# Altium schematic sheet Motor_Driver_Sheet3.SchDoc (part 1 of 2)
size 420 x 297 mm; SheetNumber: 19; SheetTotal: 26
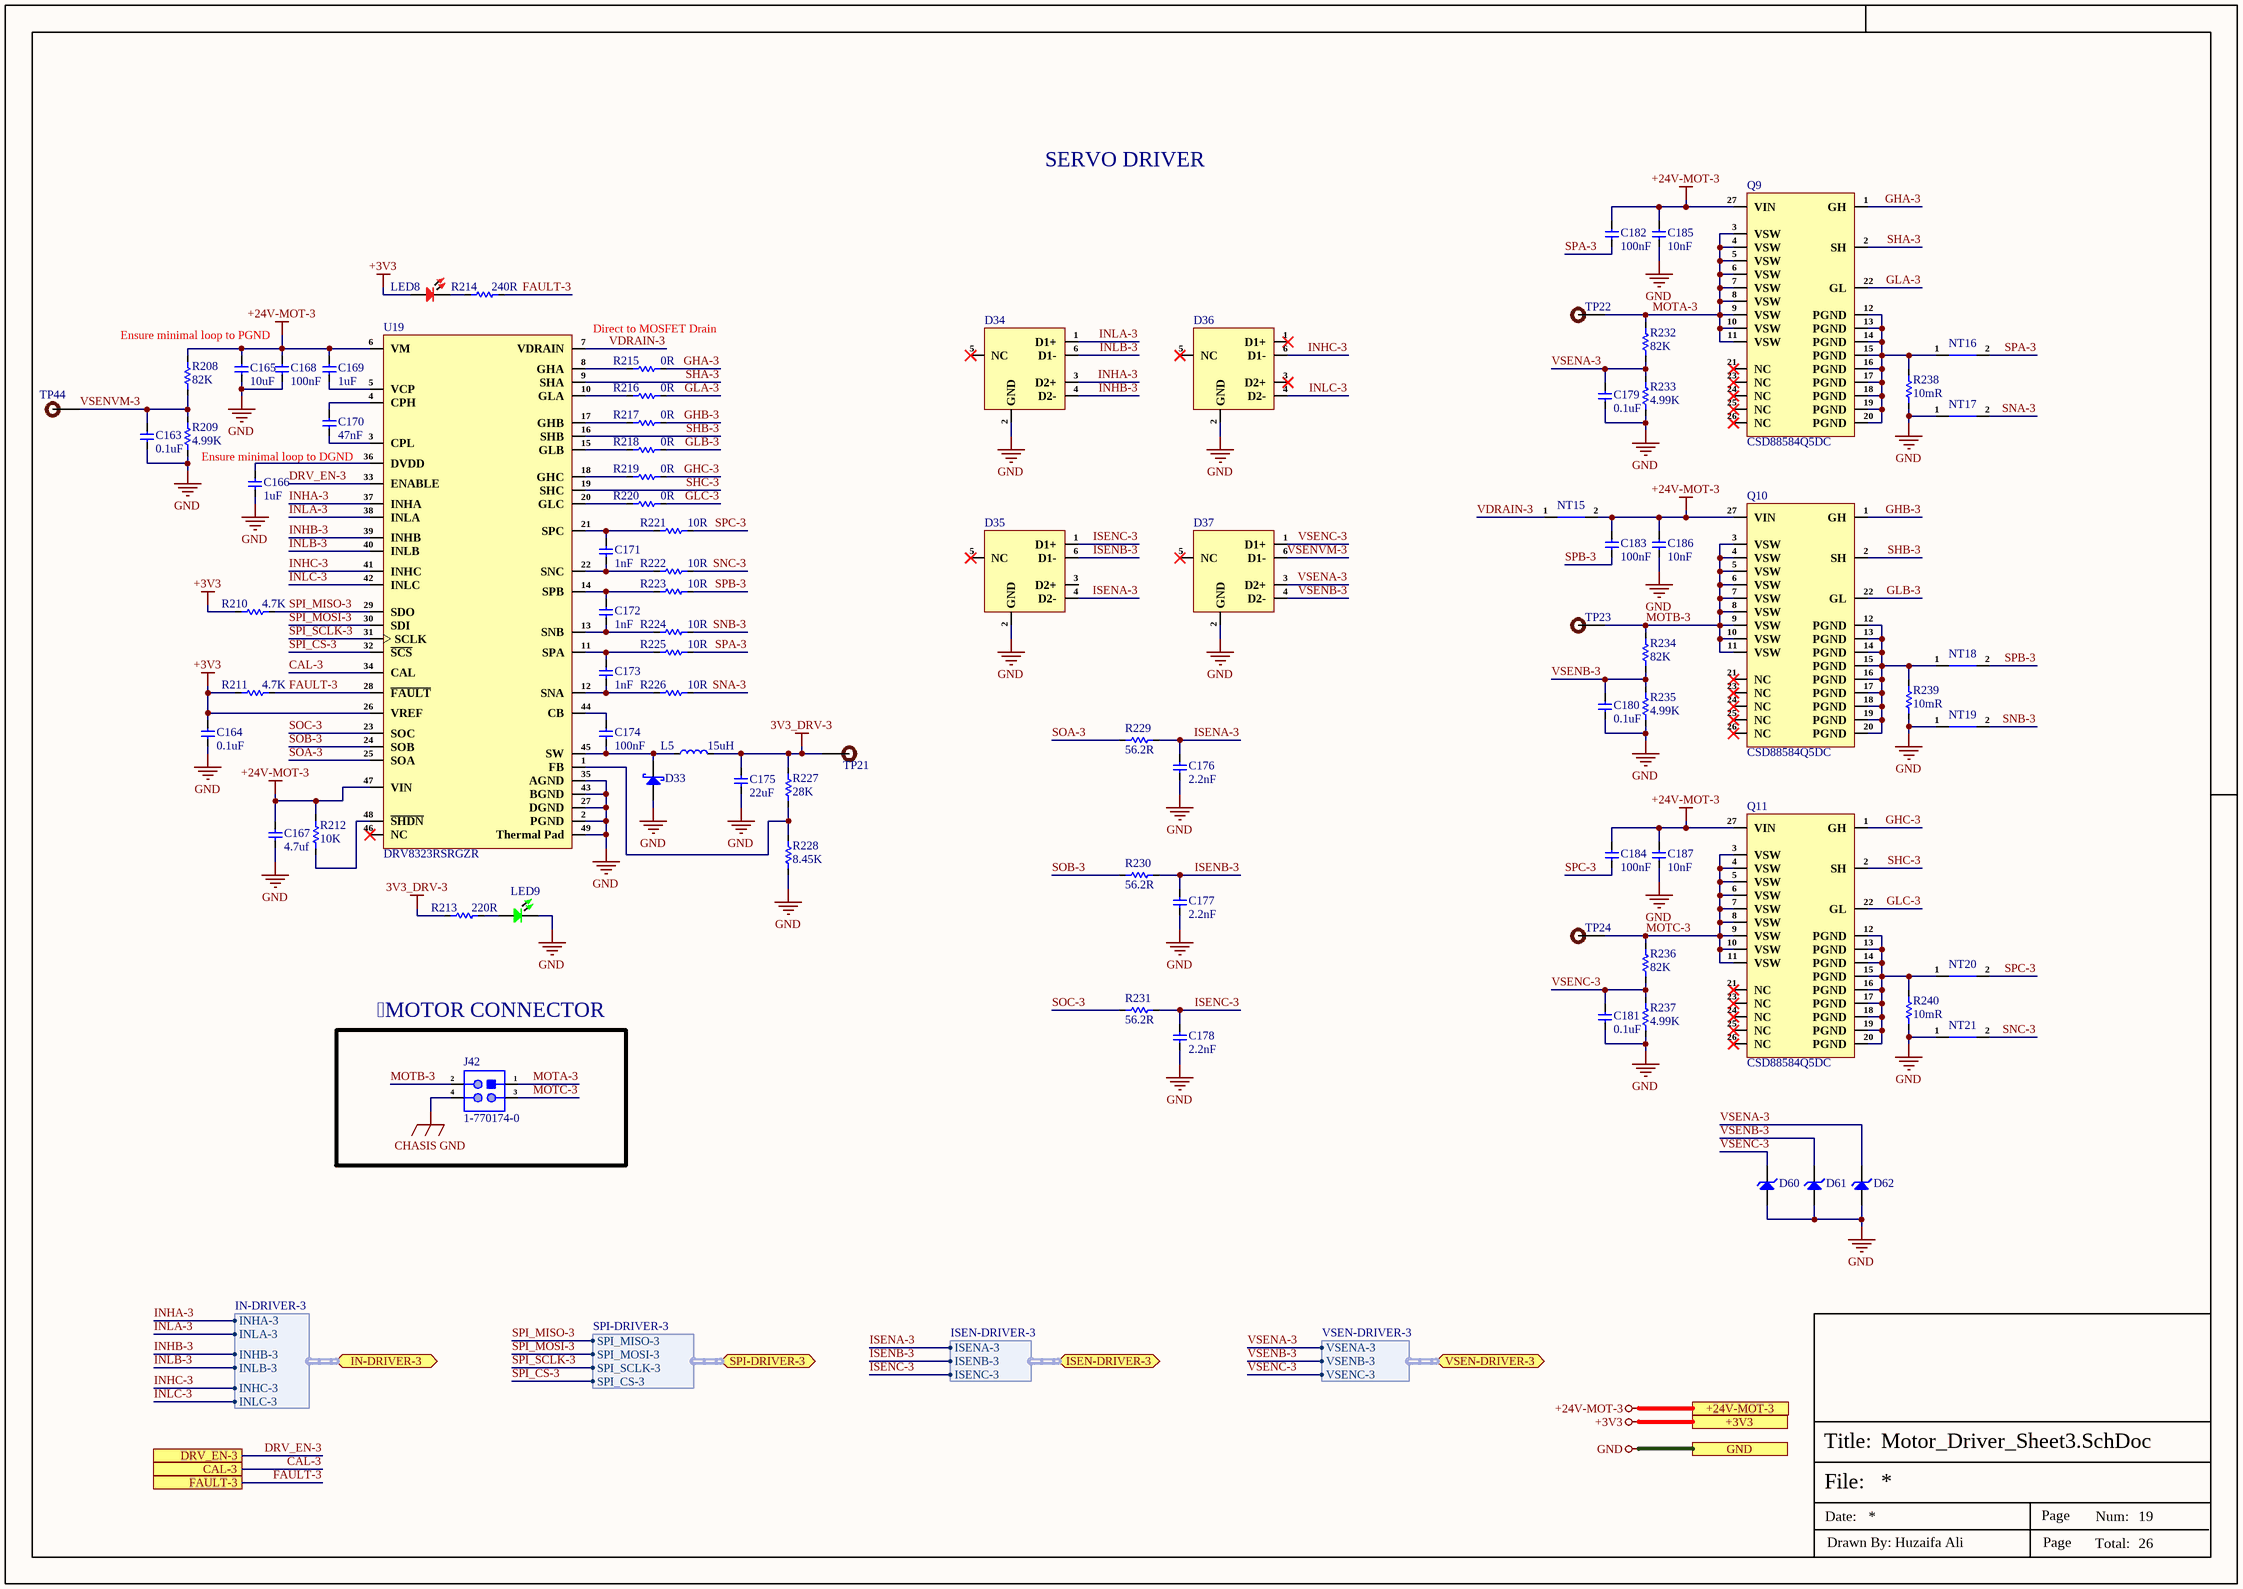
[diagram p0: Motor_Driver_Sheet3.SchDoc]

## Parts
C163  0.1uF  [Cap-0402]
C164  0.1uF  [Cap-0402]
C165  10uF  [Cap-1206]
C166  1uF  [Cap-0603]
C167  4.7uf  [Cap-0805]
C168  100nF  [Cap-0603]
C169  1uF  [Cap-0603]
C170  47nF  [Cap-0402]
C171  1nF  [Cap-0402]
C172  1nF  [Cap-0402]
C173  1nF  [Cap-0402]
C174  100nF  [Cap-0603]
C175  22uF  [Cap-0603]
C176  2.2nF  [Cap-0603]
C177  2.2nF  [Cap-0603]
C178  2.2nF  [Cap-0603]
C179  0.1uF  [Cap-0402]
C180  0.1uF  [Cap-0402]
C181  0.1uF  [Cap-0402]
C182  100nF  [Cap-0603]
C183  100nF  [Cap-0603]
C184  100nF  [Cap-0603]
C185  10nF  [Cap-0402]
C186  10nF  [Cap-0402]
C187  10nF  [Cap-0402]
D33  SS24A  [SMA]  (value not drawn)
D34  TPD4E1U06DCKR  [SOT-363]  (value not drawn)
D35  TPD4E1U06DCKR  [SOT-363]  (value not drawn)
D36  TPD4E1U06DCKR  [SOT-363]  (value not drawn)
D37  TPD4E1U06DCKR  [SOT-363]  (value not drawn)
D60  MM3Z3V3B  [SOD323F]  (value not drawn)
D61  MM3Z3V3B  [SOD323F]  (value not drawn)
D62  MM3Z3V3B  [SOD323F]  (value not drawn)
J42  1-770174-0  [1-770174-0]
L5  15uH  [FEXL0550A-150M]
LED8  RED  [LED-0603]  (value not drawn)
LED9  Emerald  [LED-0603]  (value not drawn)
NT15  Net Tie_SMD  [Net Tie Pad]  (value not drawn)  (net tie, no BOM)
NT16  Net Tie_SMD  [Net Tie Pad]  (value not drawn)  (net tie, no BOM)
NT17  Net Tie_SMD  [Net Tie Pad]  (value not drawn)  (net tie, no BOM)
NT18  Net Tie_SMD  [Net Tie Pad]  (value not drawn)  (net tie, no BOM)
NT19  Net Tie_SMD  [Net Tie Pad]  (value not drawn)  (net tie, no BOM)
NT20  Net Tie_SMD  [Net Tie Pad]  (value not drawn)  (net tie, no BOM)
NT21  Net Tie_SMD  [Net Tie Pad]  (value not drawn)  (net tie, no BOM)
Q9  CSD88584Q5DC  [22-VSON-CLIP (5x6)]
Q10  CSD88584Q5DC  [22-VSON-CLIP (5x6)]
Q11  CSD88584Q5DC  [22-VSON-CLIP (5x6)]
R208  82K  [Res-0603]
R209  4.99K  [Res-0603]
R210  4.7K  [Res-0402]
R211  4.7K  [Res-0402]
R212  10K  [Res-0402]
R213  220R  [Res-0603]
R214  240R  [Res-0402]
R215  0R  [Res-0402]
R216  0R  [Res-0402]
R217  0R  [Res-0402]
R218  0R  [Res-0402]
R219  0R  [Res-0402]
R220  0R  [Res-0402]
R221  10R  [Res-0603]
R222  10R  [Res-0603]
R223  10R  [Res-0603]
R224  10R  [Res-0603]
R225  10R  [Res-0603]
R226  10R  [Res-0603]
R227  28K  [Res-0402]
R228  8.45K  [Res-0402]
R229  56.2R  [Res-0603]
R230  56.2R  [Res-0603]
R231  56.2R  [Res-0603]
R232  82K  [Res-0603]
R233  4.99K  [Res-0603]
R234  82K  [Res-0603]
R235  4.99K  [Res-0603]
R236  82K  [Res-0603]
R237  4.99K  [Res-0603]
R238  10mR  [RES-2512]
R239  10mR  [RES-2512]
R240  10mR  [RES-2512]
TP21  TEST POINT 0.5mm Dia  [Test-point - 0.5mm]  (value not drawn)  (no BOM)
TP22  TEST POINT 0.5mm Dia  [Test-point - 0.5mm]  (value not drawn)  (no BOM)
TP23  TEST POINT 0.5mm Dia  [Test-point - 0.5mm]  (value not drawn)  (no BOM)
TP24  TEST POINT 0.5mm Dia  [Test-point - 0.5mm]  (value not drawn)  (no BOM)
TP44  TEST POINT 0.5mm Dia  [Test-point - 0.5mm]  (value not drawn)  (no BOM)
U19  DRV8323RSRGZR  [48-VQFN (7x7)]

## Ports
+3V3 (see Servo3[2A], CAN_Sheet[4D], Controller_Sheet[5D], DIO_1[5D], DIO_2[5D], DIO_3[5D], DIO_4[5D], Encoder_Sheet1[5D], Encoder_Sheet2[4D], Encoder_Sheet3[4D], Encoder_Sheet4[5D], EtherCAT_Sheet[5D], Motor_Driver_Sheet1[5D], Motor_Driver_Sheet2[5D], Motor_Driver_Sheet4[5D], Power_Sheet[5D], RS485_RS232_Sheet[5D], Sec_Controller_Sheet1[5D], Sec_Controller_Sheet2[5D], Sec_Controller_Sheet3[5D], Sec_Controller_Sheet4[5D], Servo1[5D], Servo2[5D], Servo3[5D], Servo4[5D]), +24V-MOT-3 (see Servo3[2A], Power_Sheet[5D], Servo3[5D]), CAL-3 (see Servo3[2B], Sec_Controller_Sheet3[2D]), DRV_EN-3 (see Servo3[2B], Sec_Controller_Sheet3[2D]), FAULT-3 (see Servo3[2B], Sec_Controller_Sheet3[2D]), GND (see Servo3[2B], CAN_Sheet[4D], Controller_Sheet[5D], DIO_1[5D], DIO_2[5D], DIO_3[5D], DIO_4[5D], Encoder_Sheet1[5D], Encoder_Sheet2[4D], Encoder_Sheet3[4D], Encoder_Sheet4[5D], EtherCAT_Sheet[5D], Motor_Driver_Sheet1[5D], Motor_Driver_Sheet2[5D], Motor_Driver_Sheet4[5D], Power_Sheet[5D], RS485_RS232_Sheet[5D], Sec_Controller_Sheet1[5D], Sec_Controller_Sheet2[5D], Sec_Controller_Sheet3[5D], Sec_Controller_Sheet4[5D], Servo1[5D], Servo2[5D], Servo3[5D], Servo4[5D]), IN-DRIVER-3 (bidir, harness IN-DRIVER-3, see Servo3[2B], Sec_Controller_Sheet3[2C]), ISEN-DRIVER-3 (bidir, harness ISEN-DRIVER-3, see Servo3[2B], Sec_Controller_Sheet3[2D]), SPI-DRIVER-3 (bidir, harness SPI-DRIVER-3, see Servo3[2B], Sec_Controller_Sheet3[2D]), VSEN-DRIVER-3 (bidir, harness VSEN-DRIVER-3, see Servo3[2B], Sec_Controller_Sheet3[3C])

## Harnesses
IN-DRIVER-3: INHA-3, INLA-3, INHB-3, INLB-3, INHC-3, INLC-3
SPI-DRIVER-3: SPI_MISO-3, SPI_MOSI-3, SPI_SCLK-3, SPI_CS-3
ISEN-DRIVER-3: ISENA-3, ISENB-3, ISENC-3
VSEN-DRIVER-3: VSENA-3, VSENB-3, VSENC-3

## Nets
3V3_DRV-3: C175.2 L5.2 R213.1 R227.2 TP21.1
+3V3: C164.2 LED8.1 R210.1 R211.1 U19.26(VREF) ; port +3V3
+24V-MOT-3: C165.2 C167.2 C168.2 C169.2 C182.2 C183.2 C184.2 C185.2 C186.2 C187.2 NT15.2 Q9.27(VIN) Q10.27(VIN) Q11.27(VIN) R208.2 R212.1 U19.6(VM) U19.47(VIN) ; port +24V-MOT-3
CHASIS GND: J42.4
GND: C163.1 C164.1 C165.1 C166.1 C167.1 C168.1 C175.1 C176.1 C177.1 C178.1 C179.1 C180.1 C181.1 C185.1 C186.1 C187.1 D33.2(A) D34.2(GND) D35.2(GND) D36.2(GND) D37.2(GND) D60.1(A) D61.1(A) D62.1(A) LED9.2 NT17.1 NT19.1 NT21.1 R209.1 R228.1 R233.1 R235.1 R237.1 R238.1 R239.1 R240.1 U19.2(PGND) U19.27(DGND) U19.35(AGND) U19.43(BGND) U19.49(Thermal_Pad) ; port GND
CAL-3: U19.34(CAL) ; port CAL-3
DRV_EN-3: U19.33(ENABLE) ; port DRV_EN-3
FAULT-3: R211.2 R214.2 U19.28(~{FAULT}) ; port FAULT-3
GHA-3: Q9.1(GH) R215.2
GHB-3: Q10.1(GH) R217.2
GHC-3: Q11.1(GH) R219.2
GLA-3: Q9.22(GL) R216.2
GLB-3: Q10.22(GL) R218.2
GLC-3: Q11.22(GL) R220.2
INHA-3: D34.3(D2+) U19.37(INHA) ; port IN-DRIVER-3.INHA-3
INHB-3: D34.4(D2-) U19.39(INHB) ; port IN-DRIVER-3.INHB-3
INHC-3: D36.6(D1-) U19.41(INHC) ; port IN-DRIVER-3.INHC-3
INLA-3: D34.1(D1+) U19.38(INLA) ; port IN-DRIVER-3.INLA-3
INLB-3: D34.6(D1-) U19.40(INLB) ; port IN-DRIVER-3.INLB-3
INLC-3: D36.4(D2-) U19.42(INLC) ; port IN-DRIVER-3.INLC-3
ISENA-3: C176.2 D35.4(D2-) R229.2 ; port ISEN-DRIVER-3.ISENA-3
ISENB-3: C177.2 D35.6(D1-) R230.2 ; port ISEN-DRIVER-3.ISENB-3
ISENC-3: C178.2 D35.1(D1+) R231.2 ; port ISEN-DRIVER-3.ISENC-3
MOTA-3: J42.1 Q9.3(VSW) Q9.4(VSW) Q9.5(VSW) Q9.6(VSW) Q9.7(VSW) Q9.8(VSW) Q9.9(VSW) Q9.10(VSW) Q9.11(VSW) R232.2 TP22.1
MOTB-3: J42.2 Q10.3(VSW) Q10.4(VSW) Q10.5(VSW) Q10.6(VSW) Q10.7(VSW) Q10.8(VSW) Q10.9(VSW) Q10.10(VSW) Q10.11(VSW) R234.2 TP23.1
MOTC-3: J42.3 Q11.3(VSW) Q11.4(VSW) Q11.5(VSW) Q11.6(VSW) Q11.7(VSW) Q11.8(VSW) Q11.9(VSW) Q11.10(VSW) Q11.11(VSW) R236.2 TP24.1
SHA-3: Q9.2(SH) U19.9(SHA)
SHB-3: Q10.2(SH) U19.16(SHB)
SHC-3: Q11.2(SH) U19.19(SHC)
SNA-3: NT17.2 R226.2
SNB-3: NT19.2 R224.2
SNC-3: NT21.2 R222.2
SOA-3: R229.1 U19.25(SOA)
SOB-3: R230.1 U19.24(SOB)
SOC-3: R231.1 U19.23(SOC)
SPA-3: C182.1 NT16.2 R225.2
SPB-3: C183.1 NT18.2 R223.2
SPC-3: C184.1 NT20.2 R221.2
SPI_CS-3: U19.32(~{SCS}) ; port SPI-DRIVER-3.SPI_CS-3
SPI_MISO-3: R210.2 U19.29(SDO) ; port SPI-DRIVER-3.SPI_MISO-3
SPI_MOSI-3: U19.30(SDI) ; port SPI-DRIVER-3.SPI_MOSI-3
SPI_SCLK-3: U19.31(SCLK) ; port SPI-DRIVER-3.SPI_SCLK-3
VDRAIN-3: NT15.1 U19.7(VDRAIN)
VSENA-3: C179.2 D37.3(D2+) D62.2(K) R232.1 R233.2 ; port VSEN-DRIVER-3.VSENA-3
VSENB-3: C180.2 D37.4(D2-) D61.2(K) R234.1 R235.2 ; port VSEN-DRIVER-3.VSENB-3
VSENC-3: C181.2 D37.1(D1+) D60.2(K) R236.1 R237.2 ; port VSEN-DRIVER-3.VSENC-3
VSENVM-3: C163.2 D37.6(D1-) R208.1 R209.2 TP44.1
NetC166_2: C166.2 U19.36(DVDD)
NetC169_1: C169.1 U19.5(VCP)
NetC170_1: C170.1 U19.3(CPL)
NetC170_2: C170.2 U19.4(CPH)
NetC171_1: C171.1 R222.1 U19.22(SNC)
NetC171_2: C171.2 R221.1 U19.21(SPC)
NetC172_1: C172.1 R224.1 U19.13(SNB)
NetC172_2: C172.2 R223.1 U19.14(SPB)
NetC173_1: C173.1 R226.1 U19.12(SNA)
NetC173_2: C173.2 R225.1 U19.11(SPA)
NetC174_1: C174.1 D33.1(K) L5.1 U19.45(SW)
NetC174_2: C174.2 U19.44(CB)
NetLED8_2: LED8.2 R214.1
NetLED9_1: LED9.1 R213.2
NetNT16_1: NT16.1 Q9.12(PGND) Q9.13(PGND) Q9.14(PGND) Q9.15(PGND) Q9.16(PGND) Q9.17(PGND) Q9.18(PGND) Q9.19(PGND) Q9.20(PGND) R238.2
NetNT18_1: NT18.1 Q10.12(PGND) Q10.13(PGND) Q10.14(PGND) Q10.15(PGND) Q10.16(PGND) Q10.17(PGND) Q10.18(PGND) Q10.19(PGND) Q10.20(PGND) R239.2
NetNT20_1: NT20.1 Q11.12(PGND) Q11.13(PGND) Q11.14(PGND) Q11.15(PGND) Q11.16(PGND) Q11.17(PGND) Q11.18(PGND) Q11.19(PGND) Q11.20(PGND) R240.2
NetR212_2: R212.2 U19.48(~{SHDN})
NetR215_1: R215.1 U19.8(GHA)
NetR216_1: R216.1 U19.10(GLA)
NetR217_1: R217.1 U19.17(GHB)
NetR218_1: R218.1 U19.15(GLB)
NetR219_1: R219.1 U19.18(GHC)
NetR220_1: R220.1 U19.20(GLC)
NetR227_1: R227.1 R228.2 U19.1(FB)

Not connected (* = marked no-connect by the designer): D34 5(NC)*; D35 3(D2+) 5(NC)*; D36 1(D1+)* 3(D2+)* 5(NC)*; D37 5(NC)*; Q9 21(NC)* 23(NC)* 24(NC)* 25(NC)* 26(NC)*; Q10 21(NC)* 23(NC)* 24(NC)* 25(NC)* 26(NC)*; Q11 21(NC)* 23(NC)* 24(NC)* 25(NC)* 26(NC)*; U19 46(NC)*

## Notes on the sheet
- SERVO DRIVER
- Direct to MOSFET Drain
- Ensure minimal loop to PGND
- Ensure minimal loop to DGND
- MOTOR CONNECTOR
- File:
- Title:
- Date:
- Page
- Num:
- Total:
- Drawn By: Huzaifa Ali